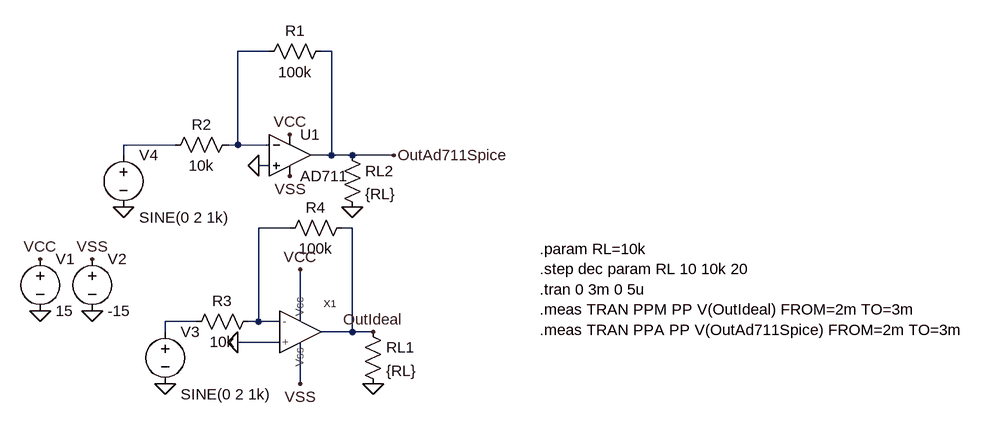
[diagram p0: schematic InversorSarcina.asc]
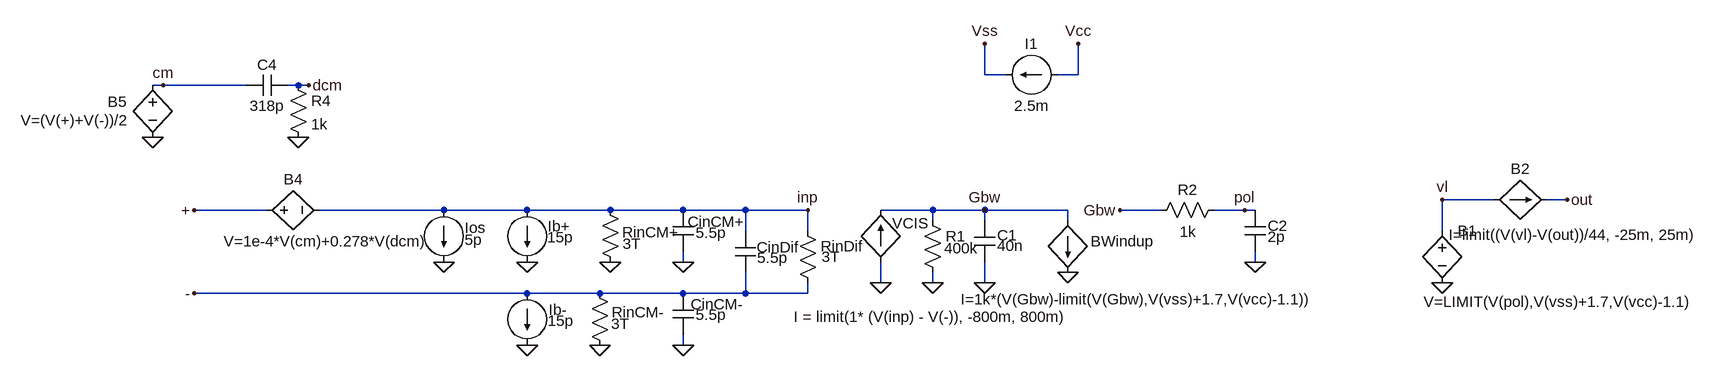
[diagram p1: sub-circuit aoideal.asc]
InversorSarcina.asc, the LTspice schematic file:
Version 4.1
SHEET 1 1008 680
WIRE 192 -128 144 -128
WIRE 288 -128 272 -128
WIRE 48 16 -32 16
WIRE 144 16 144 -128
WIRE 144 16 128 16
WIRE 192 16 144 16
WIRE -32 32 -32 16
WIRE 288 32 288 -128
WIRE 288 32 256 32
WIRE 320 32 288 32
WIRE 384 32 320 32
WIRE 192 48 176 48
WIRE 224 144 176 144
WIRE 320 144 304 144
WIRE 80 288 32 288
WIRE 176 288 176 144
WIRE 176 288 160 288
WIRE 208 288 176 288
WIRE 240 288 240 208
WIRE 32 304 32 288
WIRE 320 304 320 144
WIRE 320 304 272 304
WIRE 352 304 320 304
WIRE 208 320 144 320
WIRE 240 384 240 320
FLAG -160 272 0
FLAG -80 272 0
FLAG -160 192 VCC
FLAG -80 192 VSS
FLAG 224 0 VCC
FLAG 240 208 VCC
FLAG 240 384 VSS
FLAG 224 64 VSS
FLAG 352 304 OutIdeal
FLAG 384 32 OutAd711Spice
FLAG 144 320 0
FLAG 176 48 0
FLAG 32 384 0
FLAG -32 112 0
FLAG 320 112 0
FLAG 352 384 0
SYMBOL OpAmps\\AD711 224 -32 R0
SYMATTR InstName U1
SYMBOL AoIdeal 208 304 R0
SYMATTR InstName X1
SYMBOL voltage -160 176 R0
SYMATTR InstName V1
SYMATTR Value 15
SYMBOL voltage -80 176 R0
SYMATTR InstName V2
SYMATTR Value -15
SYMBOL voltage 32 288 R0
WINDOW 123 24 112 Left 2
WINDOW 39 0 0 Left 0
SYMATTR Value2 SINE(0 2 1k)
SYMATTR InstName V3
SYMATTR Value ""
SYMBOL voltage -32 16 R0
WINDOW 123 24 112 Left 2
WINDOW 39 0 0 Left 0
SYMATTR Value2 SINE(0 2 1k)
SYMATTR InstName V4
SYMATTR Value ""
SYMBOL res 288 -144 R90
WINDOW 0 0 56 VBottom 2
WINDOW 3 32 56 VTop 2
SYMATTR InstName R1
SYMATTR Value 100k
SYMBOL res 144 0 R90
WINDOW 0 0 56 VBottom 2
WINDOW 3 32 56 VTop 2
SYMATTR InstName R2
SYMATTR Value 10k
SYMBOL res 176 272 R90
WINDOW 0 0 56 VBottom 2
WINDOW 3 32 56 VTop 2
SYMATTR InstName R3
SYMATTR Value 10k
SYMBOL res 320 128 R90
WINDOW 0 0 56 VBottom 2
WINDOW 3 32 56 VTop 2
SYMATTR InstName R4
SYMATTR Value 100k
SYMBOL res 304 16 R0
SYMATTR InstName RL2
SYMATTR Value {RL}
SYMBOL res 336 288 R0
SYMATTR InstName RL1
SYMATTR Value {RL}
TEXT 608 176 Left 2 !.param RL=10k\n.step dec param RL 10 10k 20\n.tran 0 3m 0 5u\n.meas TRAN PPM PP V(OutIdeal) FROM=2m TO=3m\n.meas TRAN PPA PP V(OutAd711Spice) FROM=2m TO=3m

aoideal.asc, the sub-circuit schematic file:
Version 4.1
SHEET 1 2688 1516
WIRE 272 -128 272 -176
WIRE 304 -128 272 -128
WIRE 416 -128 416 -176
WIRE 416 -128 384 -128
WIRE -992 -112 -1008 -112
WIRE -864 -112 -992 -112
WIRE -784 -112 -800 -112
WIRE -768 -112 -784 -112
WIRE 1056 64 976 64
WIRE 1168 64 1136 64
WIRE -832 80 -944 80
WIRE -560 80 -752 80
WIRE -432 80 -560 80
WIRE -304 80 -432 80
WIRE -192 80 -304 80
WIRE -96 80 -192 80
WIRE 0 80 -96 80
WIRE 192 80 112 80
WIRE 272 80 192 80
WIRE 400 80 272 80
WIRE 544 80 480 80
WIRE 672 80 624 80
WIRE 688 80 672 80
WIRE 192 96 192 80
WIRE 272 96 272 80
WIRE 400 96 400 80
WIRE -96 112 -96 80
WIRE 0 112 0 80
WIRE 976 112 976 64
WIRE -192 160 -192 144
WIRE 688 160 688 144
WIRE 112 192 112 160
WIRE 192 192 192 176
WIRE 272 192 272 160
WIRE -432 208 -944 208
WIRE -320 208 -432 208
WIRE -192 208 -320 208
WIRE -96 208 -96 176
WIRE -96 208 -192 208
WIRE 0 208 0 192
WIRE 0 208 -96 208
WIRE -192 288 -192 272
FLAG 112 192 0
FLAG -944 208 -
FLAG -944 80 +
FLAG 192 192 0
FLAG 272 192 0
FLAG -192 160 0
FLAG -304 160 0
FLAG -432 160 0
FLAG -560 160 0
FLAG -432 288 0
FLAG -320 288 0
FLAG -192 288 0
FLAG 0 80 inp
FLAG 272 80 Gbw
FLAG 480 80 Gbw
FLAG 688 160 0
FLAG 672 80 pol
FLAG 976 192 0
FLAG 416 -176 Vcc
FLAG 272 -176 Vss
FLAG 1168 64 out
FLAG 400 176 0
FLAG 976 64 vl
FLAG -1008 -32 0
FLAG -992 -112 cm
FLAG -768 -112 dcm
FLAG -784 -32 0
SYMBOL bi 112 160 R180
WINDOW 0 -73 60 Left 2
WINDOW 3 -289 -84 Left 2
SYMATTR InstName VCIS
SYMATTR Value I = limit(1* (V(inp) - V(-)), -800m, 800m)
SYMBOL res 176 80 R0
WINDOW 3 34 59 Left 2
SYMATTR Value 400k
SYMATTR InstName R1
SYMBOL cap 256 96 R0
WINDOW 0 35 23 Left 2
WINDOW 3 35 39 Left 2
SYMATTR InstName C1
SYMATTR Value 40n
SYMBOL current -560 80 R0
WINDOW 0 32 27 Left 2
WINDOW 3 32 46 Left 2
SYMATTR InstName Ios
SYMATTR Value 5p
SYMBOL current -432 80 R0
WINDOW 0 32 25 Left 2
WINDOW 3 31 42 Left 2
SYMATTR InstName Ib+
SYMATTR Value 15p
SYMBOL current -432 208 R0
WINDOW 0 33 25 Left 2
WINDOW 3 32 42 Left 2
SYMATTR InstName Ib-
SYMATTR Value 15p
SYMBOL res -320 64 R0
WINDOW 0 34 50 Left 2
WINDOW 3 35 68 Left 2
SYMATTR InstName RinCM+
SYMATTR Value 3T
SYMBOL res -336 192 R0
WINDOW 0 34 45 Left 2
WINDOW 3 33 63 Left 2
SYMATTR InstName RinCM-
SYMATTR Value 3T
SYMBOL cap -208 208 R0
WINDOW 0 28 17 Left 2
WINDOW 3 35 33 Left 2
SYMATTR InstName CinCM-
SYMATTR Value 5.5p
SYMBOL cap -208 80 R0
WINDOW 0 23 18 Left 2
WINDOW 3 35 35 Left 2
SYMATTR InstName CinCM+
SYMATTR Value 5.5p
SYMBOL cap -112 112 R0
WINDOW 0 33 25 Left 2
WINDOW 3 34 41 Left 2
SYMATTR InstName CinDif
SYMATTR Value 5.5p
SYMBOL res -16 96 R0
WINDOW 3 37 56 Left 2
SYMATTR Value 3T
SYMATTR InstName RinDif
SYMBOL res 640 64 R90
WINDOW 0 0 56 VBottom 2
WINDOW 3 34 55 VTop 2
SYMATTR InstName R2
SYMATTR Value 1k
SYMBOL cap 672 80 R0
WINDOW 0 35 24 Left 2
WINDOW 3 35 41 Left 2
SYMATTR InstName C2
SYMATTR Value 2p
SYMBOL bv 976 96 R0
WINDOW 3 -29 125 Left 2
SYMATTR Value V=LIMIT(V(pol),V(vss)+1.7,V(vcc)-1.1)
SYMATTR InstName B1
SYMBOL current 384 -128 R90
WINDOW 0 -32 40 VBottom 2
WINDOW 3 32 40 VTop 2
SYMATTR InstName I1
SYMATTR Value 2.5m
SYMBOL bi 400 96 R0
WINDOW 0 35 32 Left 2
WINDOW 3 -165 121 Left 2
SYMATTR InstName BWindup
SYMATTR Value I=1k*(V(Gbw)-limit(V(Gbw),V(vss)+1.7,V(vcc)-1.1))
SYMBOL bi 1056 64 R270
WINDOW 0 32 40 VTop 2
WINDOW 3 -38 122 VBottom 2
SYMATTR InstName B2
SYMATTR Value I=limit((V(vl)-V(out))/44, -25m, 25m)
SYMBOL bv -848 80 R270
WINDOW 0 32 56 VTop 2
WINDOW 3 -32 106 VBottom 2
SYMATTR InstName B4
SYMATTR Value V=1e-4*V(cm)+0.278*V(dcm)
SYMBOL bv -1008 -128 R0
WINDOW 0 -69 41 Left 2
WINDOW 3 -203 70 Left 2
SYMATTR InstName B5
SYMATTR Value V=(V(+)+V(-))/2
SYMBOL cap -864 -96 R270
WINDOW 0 32 32 VTop 2
WINDOW 3 0 32 VBottom 2
SYMATTR InstName C4
SYMATTR Value 318p
SYMBOL res -800 -128 R0
SYMATTR InstName R4
SYMATTR Value 1k

The netlist it stands for:
* InversorSarcina.asc
X§U1 0 N001 VCC VSS OutAd711Spice AD712  ; pins In+ In- V+ V- OUT
X§X1 N003 0 OutIdeal VCC VSS aoideal
V1 VCC 0 15
V2 VSS 0 -15
V3 N004 0 SINE(0 2 1k)
V4 N002 0 SINE(0 2 1k)
R1 OutAd711Spice N001 100k
R2 N001 N002 10k
R3 N003 N004 10k
R4 OutIdeal N003 100k
RL2 OutAd711Spice 0 {RL}
RL1 OutIdeal 0 {RL}

* block symbol definitions
.subckt aoideal - + Out Vcc Vss
B§VCIS 0 Gbw I = limit(1* (V(inp) - V(-)), -800m, 800m)
R1 Gbw 0 400k
C1 Gbw 0 40n
Ios inp 0 5p
Ib+ inp 0 15p
Ib- - 0 15p
RinCM+ inp 0 3T
RinCM- - 0 3T
CinCM- - 0 5.5p
CinCM+ inp 0 5.5p
CinDif inp - 5.5p
RinDif inp - 3T
R2 pol Gbw 1k
C2 pol 0 2p
B1 vl 0 V=LIMIT(V(pol),V(vss)+1.7,V(vcc)-1.1)
I1 Vcc Vss 2.5m
BWindup Gbw 0 I=1k*(V(Gbw)-limit(V(Gbw),V(vss)+1.7,V(vcc)-1.1))
B2 vl out I=limit((V(vl)-V(out))/44, -25m, 25m)
B4 + inp V=1e-4*V(cm)+0.278*V(dcm)
B5 cm 0 V=(V(+)+V(-))/2
C4 cm dcm 318p
R4 dcm 0 1k
.ends aoideal

.param RL=10k
.step dec param RL 10 10k 20
.tran 0 3m 0 5u
.meas TRAN PPM PP V(OutIdeal) FROM=2m TO=3m
.meas TRAN PPA PP V(OutAd711Spice) FROM=2m TO=3m
.lib ADI1.lib
.backanno
.end

* Results of the author's LTspice run, read from the files saved beside the schematic
* Operating Point (first step), zero values left out:
*   V(outad711spice) = 2.498 µV
*   V(outideal) = 1.5 µV
*   V(vcc) = 15 V
*   V(vss) = -15 V
*   I(R1) = 24.98 pA
*   I(R4) = 15 pA
*   I(RL1) = 150 nA
*   I(RL2) = 249.8 nA
*   I(V1) = -7.399 mA
*   I(V2) = 7.398 mA
*   Ix(u1:1) = 25 pA
*   Ix(u1:2) = 25 pA
*   Ix(u1:3) = 4.899 mA
*   Ix(u1:4) = -4.898 mA
*   Ix(u1:5) = -249.8 nA
*   Ix(x1:-) = 15 pA
*   Ix(x1:out) = -150 nA
*   Ix(x1:vcc) = 2.5 mA
*   Ix(x1:vss) = -2.5 mA
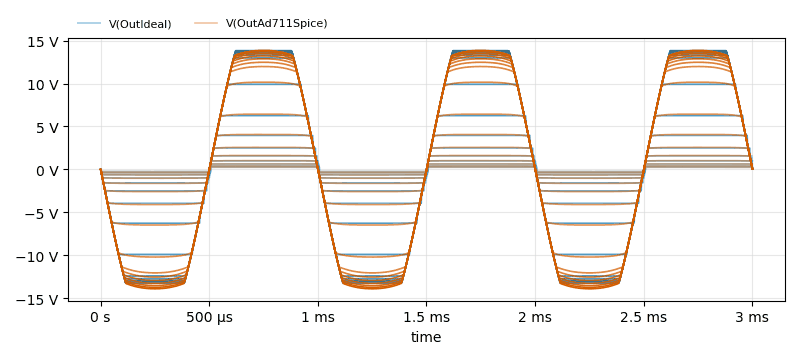
[diagram p2: Transient Analysis of InversorSarcina.asc, plotted from the saved traces]
* Transient Analysis, 61 runs:
*   V(OutIdeal) [run 1]: min -250 mV, max 250 mV, average -954.6 µV, rms 249.6 mV, last 250 mV
*   V(OutIdeal) [run 2]: min -396.2 mV, max 396.2 mV, average -1.239 mV, rms 395.4 mV, last 396.2 mV
*   V(OutIdeal) [run 3]: min -627.8 mV, max 627.8 mV, average -1.087 mV, rms 626.2 mV, last 627.8 mV
*   V(OutIdeal) [run 4]: min -994.9 mV, max 994.9 mV, average -308.1 µV, rms 989.3 mV, last 994.9 mV
*   V(OutIdeal) [run 5]: min -1.576 V, max 1.576 V, average 113.7 µV, rms 1.556 V, last 96.39 mV
*   V(OutIdeal) [run 6]: min -2.498 V, max 2.498 V, average 231.9 µV, rms 2.437 V, last 78.78 mV
*   V(OutIdeal) [run 7]: min -3.956 V, max 3.956 V, average 225.8 µV, rms 3.791 V, last 70.67 mV
*   V(OutIdeal) [run 8]: min -6.264 V, max 6.264 V, average 353.3 µV, rms 5.833 V, last 65.01 mV
*   V(OutAd711Spice) [run 1]: min -259.8 mV, max 257.4 mV, average -1 mV, rms 255.2 mV, last 174.9 mV
*   V(OutAd711Spice) [run 2]: min -411.8 mV, max 407.9 mV, average -1.346 mV, rms 404 mV, last 199.2 mV
*   V(OutAd711Spice) [run 3]: min -652.4 mV, max 646.4 mV, average -2.03 mV, rms 639 mV, last 190.7 mV
*   V(OutAd711Spice) [run 4]: min -1.034 V, max 1.024 V, average -2.992 mV, rms 1.009 V, last 169.4 mV
*   V(OutAd711Spice) [run 5]: min -1.637 V, max 1.623 V, average -4.414 mV, rms 1.588 V, last 150.1 mV
*   V(OutAd711Spice) [run 6]: min -2.593 V, max 2.571 V, average -6.37 mV, rms 2.489 V, last 131.4 mV
*   V(OutAd711Spice) [run 7]: min -4.104 V, max 4.071 V, average -8.69 mV, rms 3.871 V, last 117.5 mV
*   V(OutAd711Spice) [run 8]: min -6.486 V, max 6.441 V, average -10.34 mV, rms 5.945 V, last 99.54 mV
* From the log:
*   Measurement: ppm
*     step  PP(V(OutIdeal))  FROM  TO
*        1  0.499969899654  0.002  0.003
*        2  0.560968995094  0.002  0.003
*        3  0.62940967083  0.002  0.003
*        4  0.706197530031  0.002  0.003
*        5  0.79235342145  0.002  0.003
*        6  0.889016449451  0.002  0.003
*        7  0.997471392155  0.002  0.003
*        8  1.11915361881  0.002  0.003
*        9  1.25567698479  0.002  0.003
*       10  1.40885162354  0.002  0.003
*       11  1.58070087433  0.002  0.003
*       12  1.77350491285  0.002  0.003
*       13  1.98982185125  0.002  0.003
*       14  2.23250567913  0.002  0.003
*       15  2.504773736  0.002  0.003
*       16  2.81023144722  0.002  0.003
*       17  3.15291464329  0.002  0.003
*       18  3.5373506546  0.002  0.003
*       19  3.96863377094  0.002  0.003
*       20  4.45244717598  0.002  0.003
*       21  4.99518036842  0.002  0.003
*       22  5.60399270058  0.002  0.003
*       23  6.28692603111  0.002  0.003
*       24  7.0529665947  0.002  0.003
*       25  7.91219449043  0.002  0.003
*       26  8.87588691711  0.002  0.003
*       27  9.95674133301  0.002  0.003
*       28  11.1689281464  0.002  0.003
*       29  12.5282793045  0.002  0.003
*       30  14.0526614189  0.002  0.003
*       31  15.7619276047  0.002  0.003
*       32  17.6782894135  0.002  0.003
*       33  19.8267469406  0.002  0.003
*       34  22.2351303101  0.002  0.003
*       35  24.6891107559  0.002  0.003
*       36  25.2158975601  0.002  0.003
*       37  25.4165735245  0.002  0.003
*       38  25.5979566574  0.002  0.003
*       39  25.7616500854  0.002  0.003
*       40  25.9096403122  0.002  0.003
*     ...
*   Measurement: ppa
*     step  PP(V(OutAd711Spice))  FROM  TO
*        1  0.517262905836  0.002  0.003
*        2  0.580277204514  0.002  0.003
*        3  0.651042193174  0.002  0.003
*        4  0.730505913496  0.002  0.003
*        5  0.819606512785  0.002  0.003
*        6  0.919589340687  0.002  0.003
*        7  1.03174221516  0.002  0.003
*        8  1.15756553411  0.002  0.003
*        9  1.29874700308  0.002  0.003
*       10  1.45713764429  0.002  0.003
*       11  1.63487148285  0.002  0.003
*       12  1.83424448967  0.002  0.003
*       13  2.05790090561  0.002  0.003
*       14  2.30889582634  0.002  0.003
*       15  2.59032130241  0.002  0.003
*       16  2.90611112118  0.002  0.003
*       17  3.26035511494  0.002  0.003
*       18  3.65772175789  0.002  0.003
*       19  4.10343122482  0.002  0.003
*       20  4.60330629349  0.002  0.003
*       21  5.16400504112  0.002  0.003
*       22  5.79286551476  0.002  0.003
*       23  6.49801635742  0.002  0.003
*       24  7.28868198395  0.002  0.003
*       25  8.17515945435  0.002  0.003
*       26  9.16885852814  0.002  0.003
*       27  10.2824997902  0.002  0.003
*       28  11.5302276611  0.002  0.003
*       29  12.9276432991  0.002  0.003
*       30  14.4918985367  0.002  0.003
*       31  16.2416410446  0.002  0.003
*       32  18.196721077  0.002  0.003
*       33  20.3776531219  0.002  0.003
*       34  22.4563846588  0.002  0.003
*       35  23.4817762375  0.002  0.003
*       36  23.7716245651  0.002  0.003
*       37  24.0485086441  0.002  0.003
*       38  24.3125600815  0.002  0.003
*       39  24.564330101  0.002  0.003
*       40  24.8041000366  0.002  0.003
*     ...